# Altium schematic sheet Power.SchDoc
size 300 x 200 mm; SheetNumber: 12; SheetTotal: 11
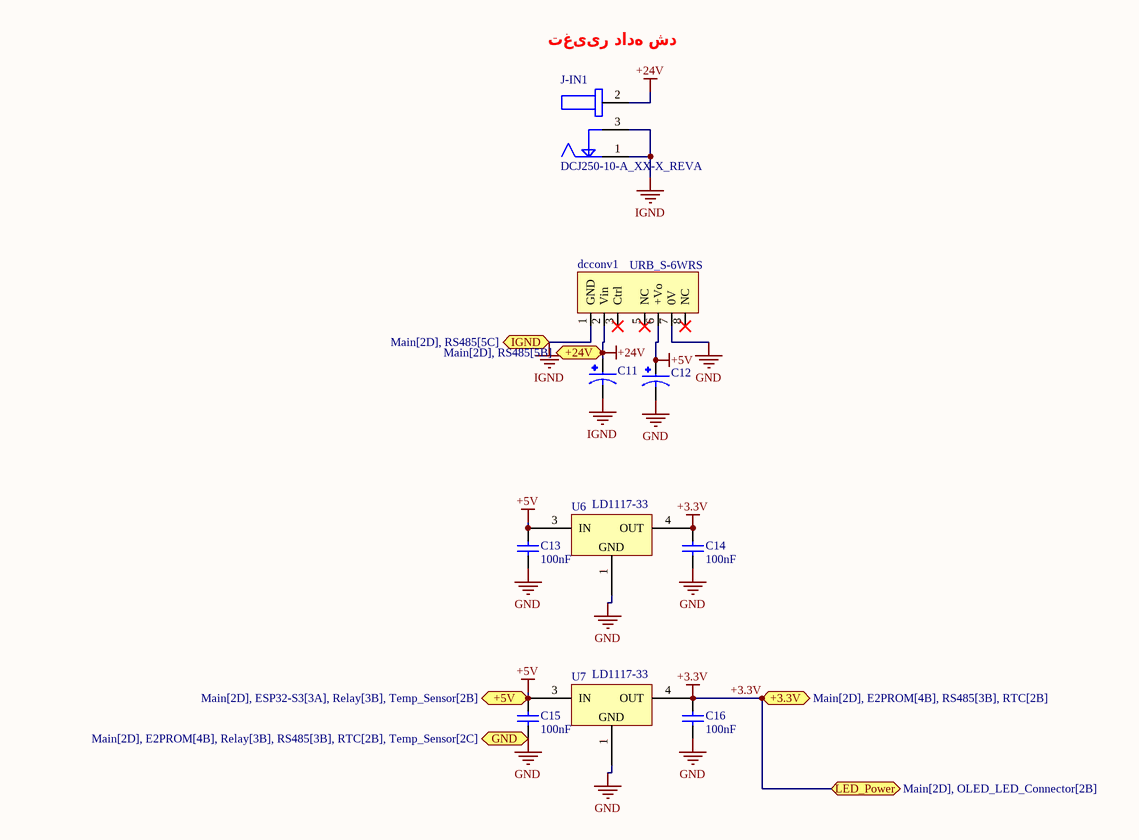
[diagram p0: Power.SchDoc]

## Parts
C11  CAP_EEEFKJ101V  [CAP_EEEFK1J101V]  (value not drawn)
C12  CAP_EEE1EA220AP  [CAP_EEE1EA220AP]  (value not drawn)
C13  100nF  [0805]
C14  100nF  [0805]
C15  100nF  [0805]
C16  100nF  [0805]
dcconv1  URB_S-6WRS  [DCDC]
J-IN1  DCJ250-10-A_XX-X_REVA  [dc power jack]
U6  LD1117-33  [TO-252]
U7  LD1117-33  [TO-252]

## Ports
+3.3V (bidir, see Main[2D], E2PROM[4B], RS485[3B], RTC[2B]), +5V (bidir, see Main[2D], ESP32-S3[3A], Relay[3B], Temp_Sensor[2B]), +24V (bidir, see Main[2D], RS485[5B]), GND (bidir, see Main[2D], E2PROM[4B], Relay[3B], RS485[3B], RTC[2B], Temp_Sensor[2C]), IGND (bidir, see Main[2D], RS485[5C]), LED_Power (bidir, see Main[2D], OLED_LED_Connector[2B])

## Nets
+3.3V: C14.2 C16.2 U6.4(OUT) U7.4(OUT) ; port LED_Power, port +3.3V
+5V: C12.1 C13.2 C15.2 dcconv1.6(+Vo) U6.3(IN) U7.3(IN) ; port +5V
+24V: C11.1 dcconv1.2(Vin) J-IN1.2 ; port +24V
GND: C12.2 C13.1 C14.1 C15.1 C16.1 dcconv1.7(0V) U6.1(GND) U7.1(GND) ; port GND
IGND: C11.2 dcconv1.1(GND) J-IN1.1 J-IN1.3 ; port IGND

Not connected (* = marked no-connect by the designer): dcconv1 3(Ctrl)* 5(NC)* 8(NC)*

## Notes on the sheet
- (near J-IN1) تغییر داده شد

## Library data of the parts
C13-C16 = 2-Cap: Bipolar Capacitor; Type: MKT
J-IN1 = DCJ250-10-A_XX-X_REVA: Power Barrel Connector Jack 2.55mm ID _0.100_, 5.50mm OD _0.217_ Through Hole, Right Angle; MP: DCJ250-10-A-K1-K; MF: Global Connector Technology; Availability: Unavailable; Package: None; Value: *; Price: None; SnapEDA_Link: https://www.snapeda.com/parts/DCJ250-10-A-K1-K/Global%20Connector%20Technology/view-part/813036/?ref=snap
U6 U7 = LD1117-33: 3.3V Regulator